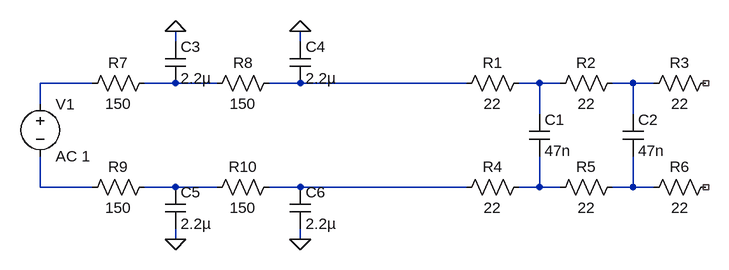
[diagram p0: schematic 2lineas_abierto.asc]
2lineas_abierto.asc, the LTspice schematic file:
Version 4.1
SHEET 1 1368 680
WIRE -592 -80 -592 -96
WIRE -400 -80 -400 -96
WIRE -720 -16 -800 -16
WIRE -592 -16 -640 -16
WIRE -528 -16 -592 -16
WIRE -400 -16 -448 -16
WIRE -144 -16 -400 -16
WIRE -32 -16 -64 -16
WIRE 0 -16 -32 -16
WIRE 112 -16 80 -16
WIRE 144 -16 112 -16
WIRE -800 16 -800 -16
WIRE -32 32 -32 -16
WIRE 112 32 112 -16
WIRE -800 144 -800 96
WIRE -720 144 -800 144
WIRE -592 144 -640 144
WIRE -528 144 -592 144
WIRE -400 144 -448 144
WIRE -144 144 -400 144
WIRE -32 144 -32 96
WIRE -32 144 -64 144
WIRE 0 144 -32 144
WIRE 112 144 112 96
WIRE 112 144 80 144
WIRE 144 144 112 144
WIRE -592 224 -592 208
WIRE -400 224 -400 208
FLAG -592 -96 0
FLAG -400 -96 0
FLAG -592 224 0
FLAG -400 224 0
SYMBOL res -48 -32 R90
WINDOW 0 0 56 VBottom 2
WINDOW 3 32 56 VTop 2
SYMATTR InstName R1
SYMATTR Value 22
SYMBOL res 96 -32 R90
WINDOW 0 0 56 VBottom 2
WINDOW 3 32 56 VTop 2
SYMATTR InstName R2
SYMATTR Value 22
SYMBOL res 240 -32 R90
WINDOW 0 0 56 VBottom 2
WINDOW 3 32 56 VTop 2
SYMATTR InstName R3
SYMATTR Value 22
SYMBOL res -48 128 R90
WINDOW 0 0 56 VBottom 2
WINDOW 3 32 56 VTop 2
SYMATTR InstName R4
SYMATTR Value 22
SYMBOL res 96 128 R90
WINDOW 0 0 56 VBottom 2
WINDOW 3 32 56 VTop 2
SYMATTR InstName R5
SYMATTR Value 22
SYMBOL res 240 128 R90
WINDOW 0 0 56 VBottom 2
WINDOW 3 32 56 VTop 2
SYMATTR InstName R6
SYMATTR Value 22
SYMBOL cap -48 32 R0
SYMATTR InstName C1
SYMATTR Value 47n
SYMBOL cap 96 32 R0
SYMATTR InstName C2
SYMATTR Value 47n
SYMBOL res -624 -32 R90
WINDOW 0 0 56 VBottom 2
WINDOW 3 32 56 VTop 2
SYMATTR InstName R7
SYMATTR Value 150
SYMBOL res -432 -32 R90
WINDOW 0 0 56 VBottom 2
WINDOW 3 32 56 VTop 2
SYMATTR InstName R8
SYMATTR Value 150
SYMBOL cap -608 -80 R0
SYMATTR InstName C3
SYMATTR Value 2.2µ
SYMBOL cap -416 -80 R0
SYMATTR InstName C4
SYMATTR Value 2.2µ
SYMBOL res -624 128 R90
WINDOW 0 0 56 VBottom 2
WINDOW 3 32 56 VTop 2
SYMATTR InstName R9
SYMATTR Value 150
SYMBOL res -432 128 R90
WINDOW 0 0 56 VBottom 2
WINDOW 3 32 56 VTop 2
SYMATTR InstName R10
SYMATTR Value 150
SYMBOL cap -608 144 R0
SYMATTR InstName C5
SYMATTR Value 2.2µ
SYMBOL cap -416 144 R0
SYMATTR InstName C6
SYMATTR Value 2.2µ
SYMBOL voltage -800 0 R0
WINDOW 123 0 0 Left 0
WINDOW 39 0 0 Left 0
SYMATTR InstName V1
SYMATTR Value AC 1

The netlist it stands for:
* 2lineas_abierto.asc
R1 N004 N003 22
R2 N005 N004 22
R3 NC_01 N005 22
R4 N009 N008 22
R5 N010 N009 22
R6 NC_02 N010 22
C1 N004 N009 47n
C2 N005 N010 47n
R7 N002 N001 150
R8 N003 N002 150
C3 0 N002 2.2µ
C4 0 N003 2.2µ
R9 N007 N006 150
R10 N008 N007 150
C5 N007 0 2.2µ
C6 N008 0 2.2µ
V1 N001 N006 AC 1
.backanno
.end